# Altium schematic sheet POWER_PMIC_RK809_CODEC.SchDoc
size A4; SheetNumber: 7; SheetTotal: 23
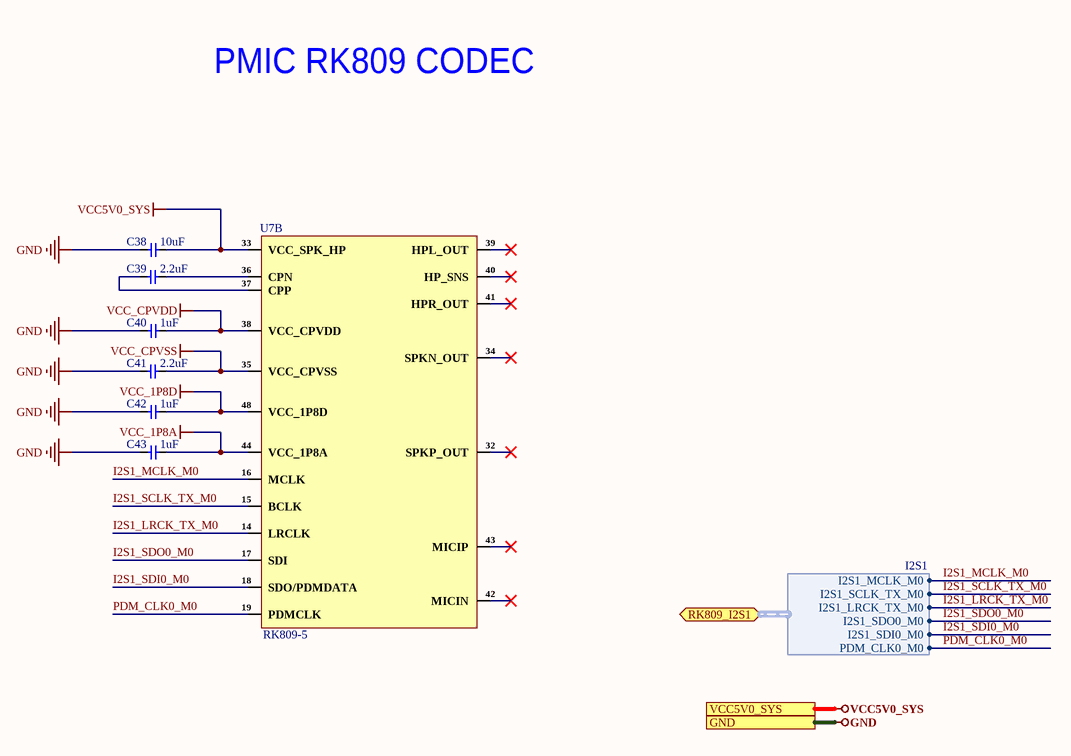
[diagram p0: POWER_PMIC_RK809_CODEC.SchDoc]

## Parts
C38  10uF  [Cap-0402]
C39  2.2uF  [Cap-0402]
C40  1uF  [Cap-0402]
C41  2.2uF  [Cap-0402]
C42  1uF  [Cap-0402]
C43  1uF  [Cap-0402]
U7  RK809-5  [68-QFN-(7x7)]  (part B of 4)

## Ports
GND (see DRAM_LPDDR4_SHEET[6D], eMMC_SPI-FLASH_SHEET[1D], HDMI2.0_SHEET[3D], POWER_LDO_SHEET[3D], POWER_OTHER_SHEET[3C], POWER_PMIC_RK809_DC DC[3D], POWER_PMIC_RK809_LDO[4C], POWER_PMIC_RK809_MGM[3D], RK3566_AUDIO_SHEET[3C], RK3566_DDR-PHY_SHEET[5D], RK3566_FLASH-SD_SHEET[4C], RK3566_OSC_PMUIO_SHEET[5D], RK3566_POWER_SHEET[3D], RK3566_SARADC_GPIO[3D], RK3566_USB_PCIe_SHEET[3D], RK3566_VI_SHEET[3D], RK3566_VO_SHEET_1[3C], RK3566_VO_SHEET_2[4C], TYPE-C_INTERFACE_SHEET[3D], TYPE-C_TO_MIPI-CSI_SHEET[5D], USB2.0_SHEET[3D], WIFI-6_SHEET[3D]), RK809_I2S1 (bidir, harness I2S1, see RK3566_AUDIO_SHEET[3C]), VCC5V0_SYS (see HDMI2.0_SHEET[3D], POWER_LDO_SHEET[3D], POWER_OTHER_SHEET[3C], POWER_PMIC_RK809_MGM[3D], RK3566_USB_PCIe_SHEET[3C], TYPE-C_INTERFACE_SHEET[3D], USB2.0_SHEET[3D])

## Harnesses
I2S1: I2S1_MCLK_M0, I2S1_SCLK_TX_M0, I2S1_LRCK_TX_M0, I2S1_SDO0_M0, I2S1_SDI0_M0, PDM_CLK0_M0

## Nets
GND: C38.2 C40.2 C41.1 C42.2 C43.2 ; port GND
VCC5V0_SYS: C38.1 U7.33(VCC_SPK_HP) ; port VCC5V0_SYS
VCC_1P8A: C43.1 U7.44(VCC_1P8A)
VCC_1P8D: C42.1 U7.48(VCC_1P8D)
VCC_CPVDD: C40.1 U7.38(VCC_CPVDD)
VCC_CPVSS: C41.2 U7.35(VCC_CPVSS)
I2S1_LRCK_TX_M0: U7.14(LRCLK) ; port RK809_I2S1.I2S1_LRCK_TX_M0
I2S1_MCLK_M0: U7.16(MCLK) ; port RK809_I2S1.I2S1_MCLK_M0
I2S1_SCLK_TX_M0: U7.15(BCLK) ; port RK809_I2S1.I2S1_SCLK_TX_M0
I2S1_SDI0_M0: U7.18(SDO/PDMDATA) ; port RK809_I2S1.I2S1_SDI0_M0
I2S1_SDO0_M0: U7.17(SDI) ; port RK809_I2S1.I2S1_SDO0_M0
PDM_CLK0_M0: U7.19(PDMCLK) ; port RK809_I2S1.PDM_CLK0_M0
NetC39_1: C39.1 U7.37(CPP)
NetC39_2: C39.2 U7.36(CPN)

Not connected (* = marked no-connect by the designer): U7 32(SPKP_OUT)* 34(SPKN_OUT)* 39(HPL_OUT)* 40(HP_SNS)* 41(HPR_OUT)* 42(MICIN)* 43(MICIP)*

## Notes on the sheet
- PMIC RK809 CODEC
- File:
- Title:
- Date:
- Page
- Num:
- Total:
- Drawn By: Huzaifa Ali

## Library data of the parts
C38 = CC0402MRX5R6BB106: CAP CER 10UF 10V X5R 0402; Manufacturer: Yageo; Tolerance: 20%; Item Type: Capacitor; Supplier 1: Future Electronics; Manufacturer Part Number: CC0402MRX5R6BB106; RoHS: Yes; Category: Ceramic Capacitors; Stock 1: 80000; Pricing 1: 10000=0.02650, 20000=0.02590, 30000=0.02550, 40000=0.02530, 50000=0.02450 (USD); Mount: Surface Mount; Case/Package: 0402; Case Code (Metric): 1005; Case Code (Imperial): 0402; Min Operating Temperature: -55°C; Max Operating Temperature: 85°C; Capacitance: 10uF; Packaging: Tape and Reel; Voltage Rating: 10V; RoHS Compliant: Yes; ComponentLink1URL: http://www.yageo.com/documents/recent/UPY-GPHC_X5R_4V-to-50V_25.pdf?src-supplier=Digi-Key; ComponentLink1Description: http://www.yageo.com/documents/recent/UPY-GPHC_X5R_4V-to-50V_25.pdf?src-supplier=Digi-Key; Supplier Part Number 1: 6097631; LCSC Part Number: C962143
C39 C41 = C1005X5R0J225KTJA0E: CAP CER 2.2UF 6.3V X5R 0402; Manufacturer: TDK; Item Type: Capacitor; LCSC Part Number: C343036; Manufacturer Part Number: C1005X5R0J225KTJA0E; ComponentLink1Description: LCSC; ComponentLink1URL: https://www.lcsc.com/product-detail/Multilayer-Ceramic-Capacitors-MLCC-SMD-SMT_TDK-C1005X5R0J225KTJA0E_C343036.html
C40 C42 C43 = CC0402KRX5R6BB105: CAP CER 1UF 10V X5R 0402; Manufacturer: Yageo; Tolerance: 10%; Dissipation Factor: 15%; Item Type: Capacitor; Supplier 1: Mouser; Manufacturer Part Number: CC0402KRX5R6BB105; RoHS: Yes; Category: Ceramic Capacitors; Stock 1: 6711367; Pricing 1: 1=0.11000, 10=0.05500, 50=0.05500, 100=0.03300, 500=0.02700, 1000=0.02200, 2500=0.02100, 10000=0.01800 (USD); Mount: Surface Mount; Case/Package: 0402; Number of Pins: 2; Case Code (Metric): 1005; Case Code (Imperial): 0402; Min Operating Temperature: -55°C; Max Operating Temperature: 85°C; Capacitance: 1uF; Dielectric: X5R; Package Quantity: 1; Voltage Rating: 10V; Packaging: Tape and Reel; Voltage Rating (DC): 10V; Termination: SMD/SMT; Resistor Type: Ceramic; Series: CC; Construction: Flat; Length: 1mm; Width: 0.02inch; Height: 0.5mm; Thickness: 0.022inch; Depth: 0.5mm; Radiation Hardening: No; REACH SVHC: No SVHC; Lead Free: Lead Free; Halogen Free: Halogen Free; RoHS Compliant: Yes; ComponentLink1URL: https://datasheet.ciiva.com/176/upy-gphc-x5r-4v-to-50v-12-176704.pdf?src-supplier=Digi-Key; ComponentLink1Description: https://datasheet.ciiva.com/176/upy-gphc-x5r-4v-to-50v-12-176704.pdf?src-supplier=Digi-Key; ComponentLink2URL: https://datasheet.ciiva.com/176/mlccorderingcode-176705.pdf?src-supplier=Digi-Key; ComponentLink2Description: https://datasheet.ciiva.com/176/mlccorderingcode-176705.pdf?src-supplier=Digi-Key; ComponentLink3URL: https://datasheet.ciiva.com/176/mlccorderingcode-176706.pdf?src-supplier=Digi-Key; ComponentLink3Description: https://datasheet.ciiva.com/176/mlccorderingcode-176706.pdf?src-supplier=Digi-Key; Supplier Part Number 1: 603-CC402KRX5R6BB105; LCSC Part Number: C106254
U7 = RK809-5: QFN-68-EP(7x7) Power Management Specialized - PMIC ROHS; Manufacturer: Rockchip; Item Type: IC; Manufacturer Part Number: RK809-5; Package: QFN-68-EP(7x7); LCSC Part Number: C2939628; ComponentLink1Description: LCSC; ComponentLink1URL: https://www.lcsc.com/product-detail/Power-Management-Specialized-PMIC_Rockchip-RK809-5_C2939628.html